# Altium schematic sheet Maiin.SchDoc: PROYECTO FINAL - AutoLog
size A4; Author: Nathalia Mora; Revision: V1R1; SheetNumber: 1; SheetTotal: 4; Name:: Marlyn Nathalia Mora Riascos
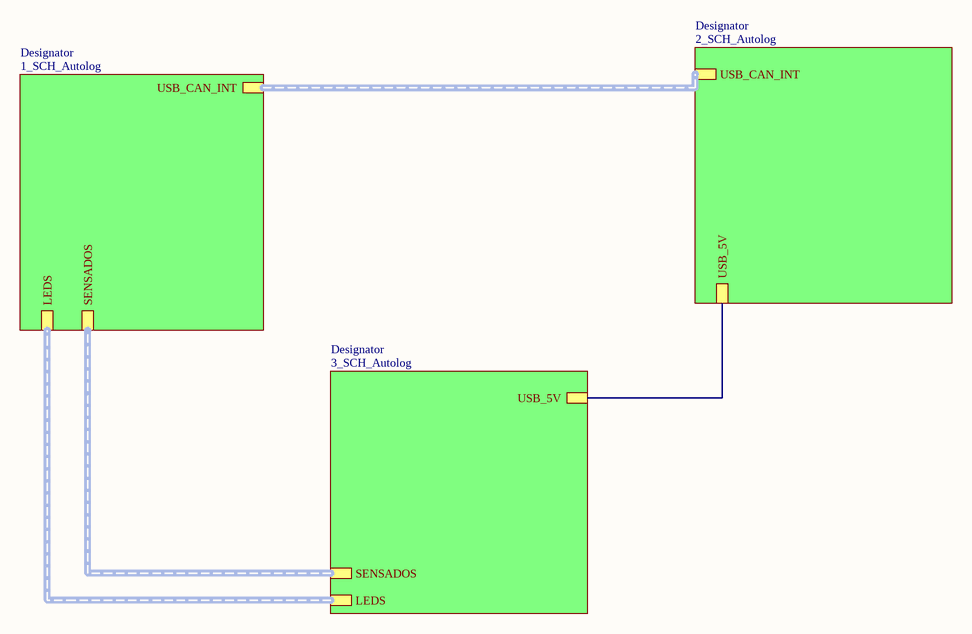
[diagram p0: Maiin.SchDoc]

## Sub-sheets
Designator = 1_SCH_Autolog: LEDS (harness LEDS_HARNEERS), SENSADOS (harness SENSADO HARNEERS), USB_CAN_INT (harness USB_CAN_INT_HARNEERS)
Designator = 2_SCH_Autolog: USB_5V, USB_CAN_INT (harness USB_CAN_INT_HARNEERS)
Designator = 3_SCH_Autolog: LEDS (harness LEDS_HARNEERS), SENSADOS (harness SENSADO HARNEERS), USB_5V

## Nets
(unnamed): sheet Designator/USB_5V, sheet Designator/USB_5V

## Notes on the sheet
- Title
- Size:
- Date:
- A4
- Number:
- Time:
- Revision:
- Sheet
- of
- Name:
- Marlyn Nathalia Mora Riascos